# Altium schematic sheet Hard_rele_310v_24v_test.SchDoc
size B; SheetNumber: 2; SheetTotal: 9
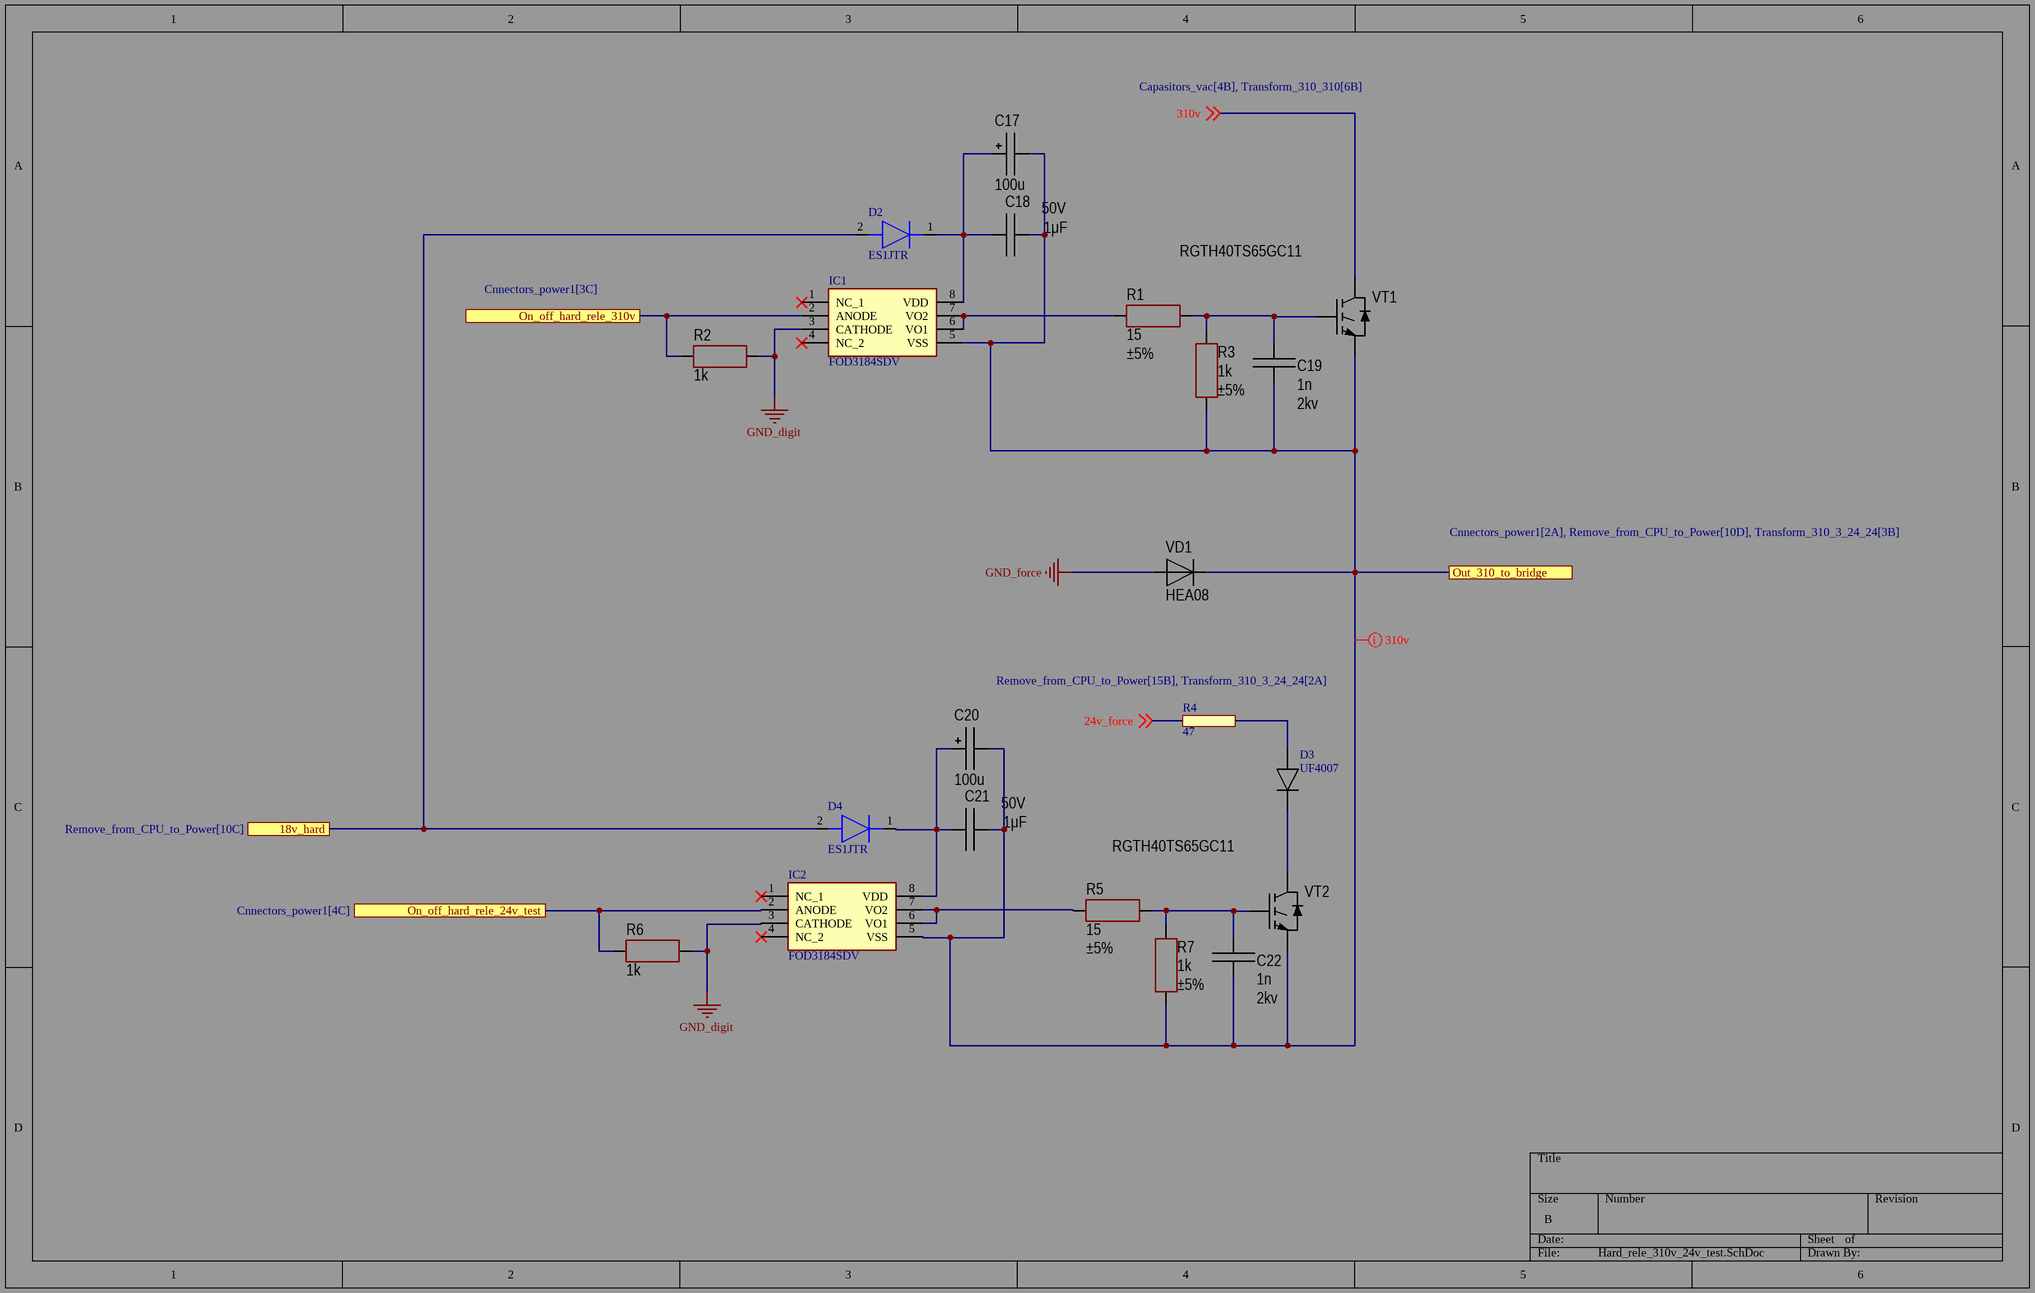
[diagram p0: Hard_rele_310v_24v_test.SchDoc]

## Parts
C17  value 100u  [CAP: D8C3.5H12]
C18  value 1μF  Voltage: 50V  [CAP: 1206]
C19  value 1n  Voltage: 2kv  [CAP: AY2102M29Y5US63L7]
C20  value 100u  [CAP: D8C3.5H12]
C21  value 1μF  Voltage: 50V  [CAP: 1206]
C22  value 1n  Voltage: 2kv  [CAP: AY2102M29Y5US63L7]
D2  ES1JTR  [DIOM5226X295N]
D3  UF4007  [THT_D_6mm_1]
D4  ES1JTR  [DIOM5226X295N]
IC1  FOD3184SDV  [SOP254P1030X508-8N]
IC2  FOD3184SDV  [SOP254P1030X508-8N]
R1  value 15  Tolerance: ±5%  [RES: 2512]
R2  value 1k  [RES: 1206]
R3  value 1k  Tolerance: ±5%  [RES: 2512]
R4  47  [THT_R_6mm_1]
R5  value 15  Tolerance: ±5%  [RES: 2512]
R6  value 1k  [RES: 1206]
R7  value 1k  Tolerance: ±5%  [RES: 2512]
VD1  PartNumber: HEA08  [TO247(D)]
VT1  PartNumber: RGTH40TS65GC11  [TO247]
VT2  PartNumber: RGTH40TS65GC11  [TO247]

## Ports
18v_hard (see Remove_from_CPU_to_Power[10C]), On_off_hard_rele_24v_test (see Cnnectors_power1[4C]), On_off_hard_rele_310v (see Cnnectors_power1[3C]), Out_310_to_bridge (see Cnnectors_power1[2A], Remove_from_CPU_to_Power[10D], Transform_310_3_24_24[3B])

## Nets
GND_digit: IC1.3(CATHODE) IC2.3(CATHODE) R2.1 R6.1
GND_force: VD1.1
18v_hard: D2.2(A) D4.2(A) ; port 18v_hard
24v_force: R4.1 ; off-sheet 24v_force
310v: VT1.2(C) ; off-sheet 310v
On_off_hard_rele_24v_test: IC2.2(ANODE) R6.2 ; port On_off_hard_rele_24v_test
On_off_hard_rele_310v: IC1.2(ANODE) R2.2 ; port On_off_hard_rele_310v
Out_310_to_bridge: C17.2 C18.1 C19.1 C20.2 C21.1 C22.1 IC1.5(VSS) IC2.5(VSS) R3.1 R7.1 VD1.2 VT1.3(E) VT2.3(E) ; port Out_310_to_bridge
NetC17_1: C17.1 C18.2 D2.1(K) IC1.8(VDD)
NetC19_2: C19.2 R1.1 R3.2 VT1.1(G)
NetC20_1: C20.1 C21.2 D4.1(K) IC2.8(VDD)
NetC22_2: C22.2 R5.1 R7.2 VT2.1(G)
NetD3_1: D3.1 R4.2
NetD3_2: D3.2 VT2.2(C)
NetIC1_6: IC1.6(VO1) IC1.7(VO2) R1.2
NetIC2_6: IC2.6(VO1) IC2.7(VO2) R5.2

Not connected (* = marked no-connect by the designer): IC1 1(NC_1)* 4(NC_2)*; IC2 1(NC_1)* 4(NC_2)*

## Layout directives
net class 310v: Out_310_to_bridge

## Library data of the parts
C17 C20 = Aluminium: Manufacturer: Wurth; PartNumber: 860080475013; ValueManufacturerPartNumber: Aluminium capacitor, 100u, 25V, ±20%, 54mOhm, 14x10x5 mm, -55...+105°C; TypeCapacitor: Aluminium capacitor; Tolerance: ±20%; Impedance: 54mOhm; Voltage: 25V; Package: 14x10x5 mm; HelpURL: https://www.digikey.com/product-detail/en/wurth-electronics-inc/860080475013/732-9029-1-ND/5728972; Temperature: -55...+105°C
C18 C21 = Ceramic_1206: Manufacturer: Yageo; PartNumber: CC1206KRX7R9BB104; ValueManufacturerPartNumber: Ceramic capacitor, 1μF, X7R, ±10%, 50V, 1206, -55...+125°C; TypeCapacitor: Ceramic capacitor; Tolerance: ±10%; TypeDielectric: X7R; Package: 1206; HelpURL: https://www.digikey.com/product-detail/en/yageo/CC1206KRX7R9BB104/311-1179-1-ND/303089; Temperature: -55...+125°C
C19 C22 = Film: Manufacturer: Epcos; PartNumber: B32774D4106K000; ValueManufacturerPartNumber: Film capacitor, 1n, 2kv, ±10%, 10.9mOhm, 31.5x15 mm, -40...+105°C; TypeCapacitor: Film capacitor; Tolerance: ±10%; Impedance: 10.9mOhm; Package: 31.5x15 mm; HelpURL: https://www.digikey.com/products/en/capacitors/film-capacitors/62?k=&pkeyword=&sv=0&pv2097=1958&sf=0&FV=fffc01ef%2C1f140000%2Cffe0003e%2Cffec6366&quantity=1&ColumnSort=1000011&page=1&stock=1&pageSize=25; Temperature: -40...+105°C
D2 D4 = ES1JTR: Diode; Manufacturer_Name: SMC Diode Solutions; Datasheet Link: http://www.smc-diodes.com/propdf/ES1(A-M)%20N0159%20REV.E.pdf; Height: 2.95mm; Manufacturer_Part_Number: ES1JTR
D3 = THT_D_6mm_1
IC1 IC2 = FOD3184SDV: Integrated Circuit; Manufacturer_Name: onsemi; Datasheet Link: https://www.arrow.com/en/products/fod3184sdv/on-semiconductor; Height: 5.08mm; Manufacturer_Part_Number: FOD3184SDV; Mouser Part Number: 512-FOD3184SDV; Mouser Price/Stock: https://www.mouser.co.uk/ProductDetail/onsemi-Fairchild/FOD3184SDV?qs=GCVmsggAYMRSO6%252BIR7fWEw%3D%3D; Arrow Part Number: FOD3184SDV; Arrow Price/Stock: https://www.arrow.com/en/products/fod3184sdv/on-semiconductor?region=nac
R1 R5 = Resistor_2512: Manufacturer: Yageo; PartNumber: RC2512JK-07100RL; ValueManufacturerPartNumber: Resistor film, 15, ±5%, 2512, 1W, -55...+125°C; TypeResistor: Resistor film; Power: 1W; Package: 2512; HelpURL: https://www.digikey.com/product-detail/en/yageo/RC2512JK-07100RL/YAG3393CT-ND/5962215; Temperature: -55...+125°C
R2 R6 = Resistor_1206: Manufacturer: Yageo; PartNumber: RC1206JR-07100RL; ValueManufacturerPartNumber: Resistor film, 1k, ±5%, 1206, 0.25W, -55...+125°C; TypeResistor: Resistor film; Power: 0.25W; Tolerance: ±5%; Package: 1206; HelpURL: https://www.digikey.com/product-detail/en/yageo/RC1206JR-07100RL/311-100ERCT-ND/732153; Temperature: -55...+125°C
R3 R7 = Resistor_2512: Manufacturer: Yageo; PartNumber: RC2512JK-07100RL; ValueManufacturerPartNumber: Resistor film, 1k, ±5%, 2512, 1W, -55...+125°C; TypeResistor: Resistor film; Power: 1W; Package: 2512; HelpURL: https://www.digikey.com/product-detail/en/yageo/RC2512JK-07100RL/YAG3393CT-ND/5962215; Temperature: -55...+125°C
R4 = THT_R_6mm_1
VD1 = Diode_single: Manufacturer: Micro Commercial; ValueManufacturerPartNumber: Single diode, 75V, 150mA, 1V, 4ns, SOD-323, -55...+150°C; TypeDiode: Single diode; Voltage: 75V; Current: 150mA; VoltageDrop: 1V; RecoveryTime: 4ns; Package: SOD-323; HelpURL: https://www.digikey.com/product-detail/en/micro-commercial-co/1N4148WX-TP/1N4148WXTPMSCT-ND/717312; Temperature: -55...+150°C
VT1 VT2 = IGBT: Manufacturer: Rohm Semiconductor; ValueManufacturerPartNumber: IGBT transistor, 650V, 40A, 40nC, 144W, 2.1V, 22ns/73ns, TO247, -55...+125°C; TypeTransistor: IGBT transistor; VoltageCE: 650V; CurrentCE: 40A; VoltageSaturation: 2.1V; GateCharge: 40nC; TimeOnOff: 22ns/73ns; MaxPower: 144W; Package: TO247; HelpURL: https://www.digikey.com/product-detail/en/rohm-semiconductor/RGTH40TS65GC11/RGTH40TS65GC11-ND/5029953; Temperature: -55...+125°C